# Altium schematic sheet Top.SchDoc: Flight Controller SoM - System Overview
size A3; Date: 11/20/2026; ApprovedBy: Weymen Koo; CheckedBy: -; Author: Weymen Koo; CompanyName: UBC AeroDesign; DrawnBy: Weymen Koo; Organization: UBC AeroDesign; DocumentNumber: UBCAD-FCSOM-SCH; Revision: A; SheetNumber: 1; SheetTotal: 18; ProjectTitle: Flight Controller SoM; Status: PRELIMINARY; ReleaseDate: 2026-11-14; FC_IdxN01: 1; FC_IdxT01: System overview; FC_IdxN02: 2; FC_IdxT02: Power; FC_IdxN03: 3; FC_IdxT03: MCU power, clock, reset; FC_IdxN04: 4; FC_IdxT04: MCU I/O; FC_IdxN05: 5; FC_IdxT05: IMU 1 LSM6DSV32X; FC_IdxN06: 6; FC_IdxT06: Baro 1 DPS368; FC_IdxN07: 7; FC_IdxT07: IMU 2 ICM-42688-P; FC_IdxN08: 8; FC_IdxT08: Baro 2 MS5611; FC_IdxN09: 9; FC_IdxT09: Mag LIS2MDL; FC_IdxN10: 10; FC_IdxT10: FRAM; FC_IdxN11: 11; FC_IdxT11: EEPROM; FC_IdxN12: 12; FC_IdxT12: microSD; FC_IdxN13: 13; FC_IdxT13: CAN FD 1; FC_IdxN14: 14; FC_IdxT14: CAN FD 2; FC_IdxN15: 15; FC_IdxT15: USB-C, SWD debug; FC_IdxN16: 16; FC_IdxT16: Status LEDs; FC_IdxN17: 17; FC_IdxT17: Carrier J4 flight I/O; FC_IdxN18: 18; FC_IdxT18: Carrier J5 payload I/O; FC_Rev1: A; FC_RevDate1: 2026-11-14; FC_RevDesc1: First release, JLCPCB fab and assembly; FC_RevBy1: Weymen Koo
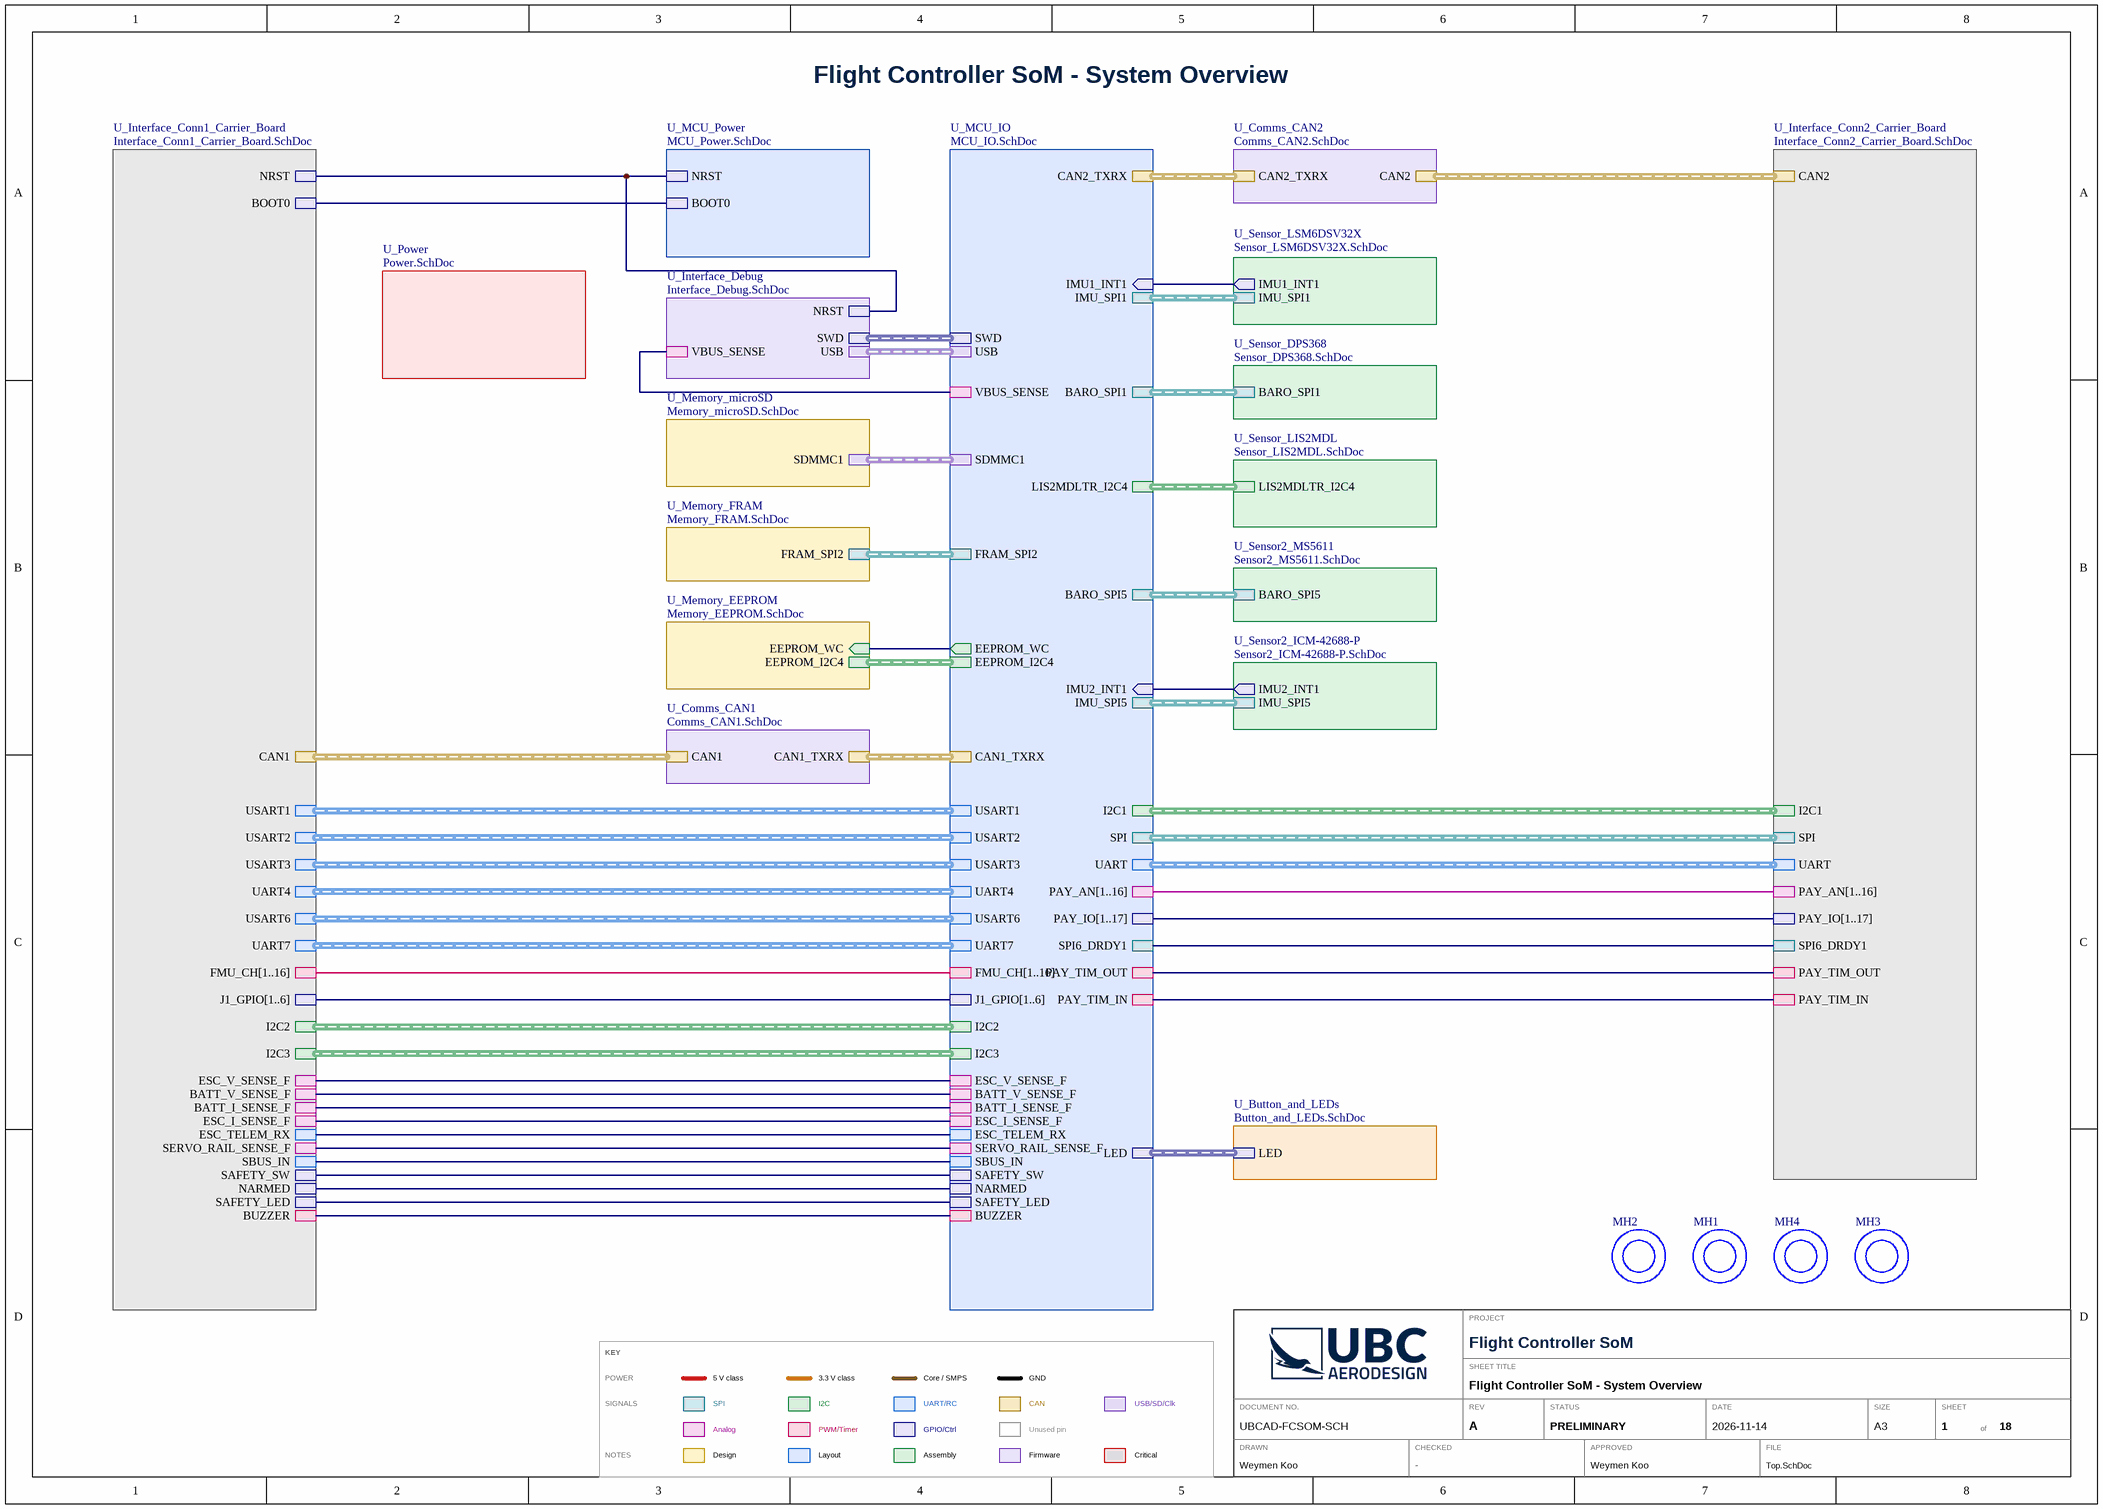
[diagram p0: Top.SchDoc]

## Parts
MH1  MH_M3_NPTH_3.2_MO6.0_KO6.5  [MH_M3_NPTH_7mmKO-Footprint-1]  (value not drawn)  (no BOM)
MH2  MH_M3_NPTH_3.2_MO6.0_KO6.5  [MH_M3_NPTH_7mmKO-Footprint-1]  (value not drawn)  (no BOM)
MH3  MH_M3_NPTH_3.2_MO6.0_KO6.5  [MH_M3_NPTH_7mmKO-Footprint-1]  (value not drawn)  (no BOM)
MH4  MH_M3_NPTH_3.2_MO6.0_KO6.5  [MH_M3_NPTH_7mmKO-Footprint-1]  (value not drawn)  (no BOM)

## Sub-sheets
U_Button_and_LEDs = Button_and_LEDs.SchDoc: LED (harness LED)
U_Comms_CAN1 = Comms_CAN1.SchDoc: CAN1 (harness CAN), CAN1_TXRX (harness TXD)
U_Comms_CAN2 = Comms_CAN2.SchDoc: CAN2 (harness CAN), CAN2_TXRX (harness TXD)
U_Interface_Conn1_Carrier_Board = Interface_Conn1_Carrier_Board.SchDoc: USART1 (harness UART), USART2 (harness UART), USART3 (harness UART), UART4 (harness UART), USART6 (harness UART), UART7 (harness UART), CAN1 (harness CAN), FMU_CH[1..16], J1_GPIO[1..6], ESC_I_SENSE_F, ESC_TELEM_RX, I2C2 (harness I2C), I2C3 (harness I2C), NRST, BATT_V_SENSE_F, BATT_I_SENSE_F, SERVO_RAIL_SENSE_F, SBUS_IN, SAFETY_SW, NARMED, SAFETY_LED, BUZZER, BOOT0, ESC_V_SENSE_F
U_Interface_Conn2_Carrier_Board = Interface_Conn2_Carrier_Board.SchDoc: CAN2 (harness CAN), UART (harness UART), SPI (harness SPI), I2C1 (harness I2C), SPI6_DRDY1, PAY_AN[1..16], PAY_IO[1..17], PAY_TIM_OUT, PAY_TIM_IN
U_Interface_Debug = Interface_Debug.SchDoc: USB (harness USB), SWD (harness SWD), NRST, VBUS_SENSE
U_MCU_IO = MCU_IO.SchDoc: USART1 (harness UART), USART2 (harness UART), USART3 (harness UART), UART4 (harness UART), USART6 (harness UART), UART7 (harness UART), CAN1_TXRX (harness TXD), EEPROM_I2C4 (harness I2C), EEPROM_WC (out), FRAM_SPI2 (harness SPI), SDMMC1 (harness SDMMC), IMU2_INT1 (in), IMU_SPI5 (harness SPI), IMU1_INT1 (in), IMU_SPI1 (harness SPI), CAN2_TXRX (harness TXD), BARO_SPI5 (harness SPI), BARO_SPI1 (harness SPI), I2C1 (harness I2C), SPI (harness SPI), UART (harness UART), SPI6_DRDY1, FMU_CH[1..16], J1_GPIO[1..6], PAY_AN[1..16], PAY_IO[1..17], USB (harness USB), SWD (harness SWD), ESC_I_SENSE_F, ESC_TELEM_RX, I2C2 (harness I2C), I2C3 (harness I2C), BATT_V_SENSE_F, BATT_I_SENSE_F, SERVO_RAIL_SENSE_F, SBUS_IN, SAFETY_SW, NARMED, SAFETY_LED, BUZZER, PAY_TIM_OUT, PAY_TIM_IN, ESC_V_SENSE_F, LIS2MDLTR_I2C4 (harness I2C), VBUS_SENSE, LED (harness LED)
U_MCU_Power = MCU_Power.SchDoc: NRST, BOOT0
U_Memory_EEPROM = Memory_EEPROM.SchDoc: EEPROM_WC (in), EEPROM_I2C4 (harness I2C)
U_Memory_FRAM = Memory_FRAM.SchDoc: FRAM_SPI2 (harness SPI)
U_Memory_microSD = Memory_microSD.SchDoc: SDMMC1 (harness SDMMC)
U_Power = Power.SchDoc: no entries
U_Sensor2_ICM-42688-P = Sensor2_ICM-42688-P.SchDoc: IMU2_INT1 (out), IMU_SPI5 (harness SPI)
U_Sensor2_MS5611 = Sensor2_MS5611.SchDoc: BARO_SPI5 (harness SPI)
U_Sensor_DPS368 = Sensor_DPS368.SchDoc: BARO_SPI1 (harness SPI)
U_Sensor_LIS2MDL = Sensor_LIS2MDL.SchDoc: LIS2MDLTR_I2C4 (harness I2C)
U_Sensor_LSM6DSV32X = Sensor_LSM6DSV32X.SchDoc: IMU1_INT1 (out), IMU_SPI1 (harness SPI)

## Nets
(unnamed): sheet U_MCU_Power/NRST, sheet U_Interface_Debug/NRST, sheet U_Interface_Conn1_Carrier_Board/NRST
(unnamed): sheet U_MCU_Power/BOOT0, sheet U_Interface_Conn1_Carrier_Board/BOOT0
(unnamed): sheet U_Memory_EEPROM/EEPROM_WC, sheet U_MCU_IO/EEPROM_WC
(unnamed): sheet U_Sensor_LSM6DSV32X/IMU1_INT1, sheet U_MCU_IO/IMU1_INT1
(unnamed): sheet U_Sensor2_ICM-42688-P/IMU2_INT1, sheet U_MCU_IO/IMU2_INT1
(unnamed): sheet U_Interface_Debug/VBUS_SENSE, sheet U_MCU_IO/VBUS_SENSE
(unnamed): sheet U_MCU_IO/SPI6_DRDY1, sheet U_Interface_Conn2_Carrier_Board/SPI6_DRDY1
(unnamed): sheet U_MCU_IO/ESC_I_SENSE_F, sheet U_Interface_Conn1_Carrier_Board/ESC_I_SENSE_F
(unnamed): sheet U_MCU_IO/ESC_TELEM_RX, sheet U_Interface_Conn1_Carrier_Board/ESC_TELEM_RX
(unnamed): sheet U_MCU_IO/BATT_V_SENSE_F, sheet U_Interface_Conn1_Carrier_Board/BATT_V_SENSE_F
(unnamed): sheet U_MCU_IO/BATT_I_SENSE_F, sheet U_Interface_Conn1_Carrier_Board/BATT_I_SENSE_F
(unnamed): sheet U_MCU_IO/SERVO_RAIL_SENSE_F, sheet U_Interface_Conn1_Carrier_Board/SERVO_RAIL_SENSE_F
(unnamed): sheet U_MCU_IO/SBUS_IN, sheet U_Interface_Conn1_Carrier_Board/SBUS_IN
(unnamed): sheet U_MCU_IO/SAFETY_SW, sheet U_Interface_Conn1_Carrier_Board/SAFETY_SW
(unnamed): sheet U_MCU_IO/NARMED, sheet U_Interface_Conn1_Carrier_Board/NARMED
(unnamed): sheet U_MCU_IO/SAFETY_LED, sheet U_Interface_Conn1_Carrier_Board/SAFETY_LED
(unnamed): sheet U_MCU_IO/BUZZER, sheet U_Interface_Conn1_Carrier_Board/BUZZER
(unnamed): sheet U_MCU_IO/PAY_TIM_OUT, sheet U_Interface_Conn2_Carrier_Board/PAY_TIM_OUT
(unnamed): sheet U_MCU_IO/PAY_TIM_IN, sheet U_Interface_Conn2_Carrier_Board/PAY_TIM_IN
(unnamed): sheet U_MCU_IO/ESC_V_SENSE_F, sheet U_Interface_Conn1_Carrier_Board/ESC_V_SENSE_F

## Buses and harness runs
bus sheet U_Interface_Conn1_Carrier_Board/FMU_CH[1..16] = sheet U_MCU_IO/FMU_CH[1..16]
bus sheet U_Interface_Conn1_Carrier_Board/J1_GPIO[1..6] = sheet U_MCU_IO/J1_GPIO[1..6]
bus sheet U_Interface_Conn2_Carrier_Board/PAY_AN[1..16] = sheet U_MCU_IO/PAY_AN[1..16]
bus sheet U_Interface_Conn2_Carrier_Board/PAY_IO[1..17] = sheet U_MCU_IO/PAY_IO[1..17]
harness sheet U_Button_and_LEDs/LED = sheet U_MCU_IO/LED
harness sheet U_Comms_CAN1/CAN1 = sheet U_Interface_Conn1_Carrier_Board/CAN1
harness sheet U_Comms_CAN1/CAN1_TXRX = sheet U_MCU_IO/CAN1_TXRX
harness sheet U_Comms_CAN2/CAN2 = sheet U_Interface_Conn2_Carrier_Board/CAN2
harness sheet U_Comms_CAN2/CAN2_TXRX = sheet U_MCU_IO/CAN2_TXRX
harness sheet U_Interface_Conn1_Carrier_Board/I2C2 = sheet U_MCU_IO/I2C2
harness sheet U_Interface_Conn1_Carrier_Board/I2C3 = sheet U_MCU_IO/I2C3
harness sheet U_Interface_Conn1_Carrier_Board/UART4 = sheet U_MCU_IO/UART4
harness sheet U_Interface_Conn1_Carrier_Board/UART7 = sheet U_MCU_IO/UART7
harness sheet U_Interface_Conn1_Carrier_Board/USART1 = sheet U_MCU_IO/USART1
harness sheet U_Interface_Conn1_Carrier_Board/USART2 = sheet U_MCU_IO/USART2
harness sheet U_Interface_Conn1_Carrier_Board/USART3 = sheet U_MCU_IO/USART3
harness sheet U_Interface_Conn1_Carrier_Board/USART6 = sheet U_MCU_IO/USART6
harness sheet U_Interface_Conn2_Carrier_Board/I2C1 = sheet U_MCU_IO/I2C1
harness sheet U_Interface_Conn2_Carrier_Board/SPI = sheet U_MCU_IO/SPI
harness sheet U_Interface_Conn2_Carrier_Board/UART = sheet U_MCU_IO/UART
harness sheet U_Interface_Debug/SWD = sheet U_MCU_IO/SWD
harness sheet U_Interface_Debug/USB = sheet U_MCU_IO/USB
harness sheet U_MCU_IO/BARO_SPI1 = sheet U_Sensor_DPS368/BARO_SPI1
harness sheet U_MCU_IO/BARO_SPI5 = sheet U_Sensor2_MS5611/BARO_SPI5
harness sheet U_MCU_IO/EEPROM_I2C4 = sheet U_Memory_EEPROM/EEPROM_I2C4
harness sheet U_MCU_IO/FRAM_SPI2 = sheet U_Memory_FRAM/FRAM_SPI2
harness sheet U_MCU_IO/IMU_SPI1 = sheet U_Sensor_LSM6DSV32X/IMU_SPI1
harness sheet U_MCU_IO/IMU_SPI5 = sheet U_Sensor2_ICM-42688-P/IMU_SPI5
harness sheet U_MCU_IO/LIS2MDLTR_I2C4 = sheet U_Sensor_LIS2MDL/LIS2MDLTR_I2C4
harness sheet U_MCU_IO/SDMMC1 = sheet U_Memory_microSD/SDMMC1

## Notes on the sheet
- PROJECT
- KEY
- POWER
- 5 V class
- 3.3 V class
- Core / SMPS
- GND
- SHEET TITLE
- SIGNALS
- NOTES
- SPI
- Analog
- Design
- I2C
- PWM/Timer
- Layout
- UART/RC
- GPIO/Ctrl
- Assembly
- CAN
- Unused pin
- Firmware
- USB/SD/Clk
- Critical
- DRAWN
- DOCUMENT NO.
- CHECKED
- REV
- STATUS
- APPROVED
- DATE
- FILE
- SIZE
- A3
- SHEET
- of

## Library data of the parts
MH1-MH4 = CMP-00043-8: Mounting hole, M3, non-plated, Ø3.2 mm finished hole, Ø6.0 mm solder mask opening (bare FR-4), Ø6.2 mm copper keepout all layers, electrically isolated